# Altium schematic sheet HMS.SIM.A7682S.SchDoc: HMS.SIM.A7682
size A4
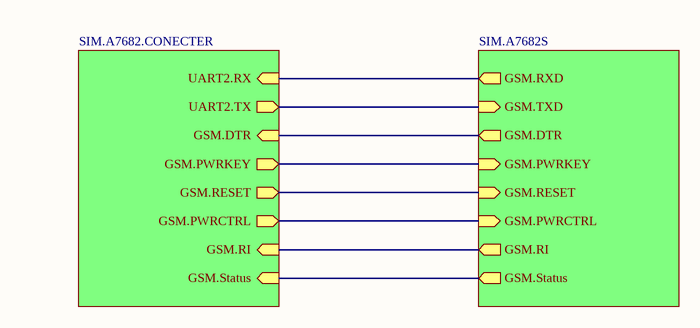
[diagram p0: HMS.SIM.A7682S.SchDoc]

## Sub-sheets
? = SIM.A7682.CONECTER: UART2.RX (in), UART2.TX (out), GSM.DTR (in), GSM.PWRKEY (out), GSM.RESET (out), GSM.PWRCTRL (out), GSM.RI (in), GSM.Status (in)
? = SIM.A7682S: GSM.RXD (out), GSM.TXD (in), GSM.DTR (out), GSM.PWRKEY (in), GSM.RESET (in), GSM.PWRCTRL (in), GSM.RI (out), GSM.Status (out)

## Nets
(unnamed): sheet /UART2.RX, sheet /GSM.RXD
(unnamed): sheet /UART2.TX, sheet /GSM.TXD
(unnamed): sheet /GSM.DTR, sheet /GSM.DTR
(unnamed): sheet /GSM.PWRKEY, sheet /GSM.PWRKEY
(unnamed): sheet /GSM.RESET, sheet /GSM.RESET
(unnamed): sheet /GSM.PWRCTRL, sheet /GSM.PWRCTRL
(unnamed): sheet /GSM.RI, sheet /GSM.RI
(unnamed): sheet /GSM.Status, sheet /GSM.Status

## Notes on the sheet
- Title
- Size:
- Date:
- A4
- Number:
- Time:
- Revision:
- Sheet
- of
- File: